# Altium project PI_Board.PrjPcb
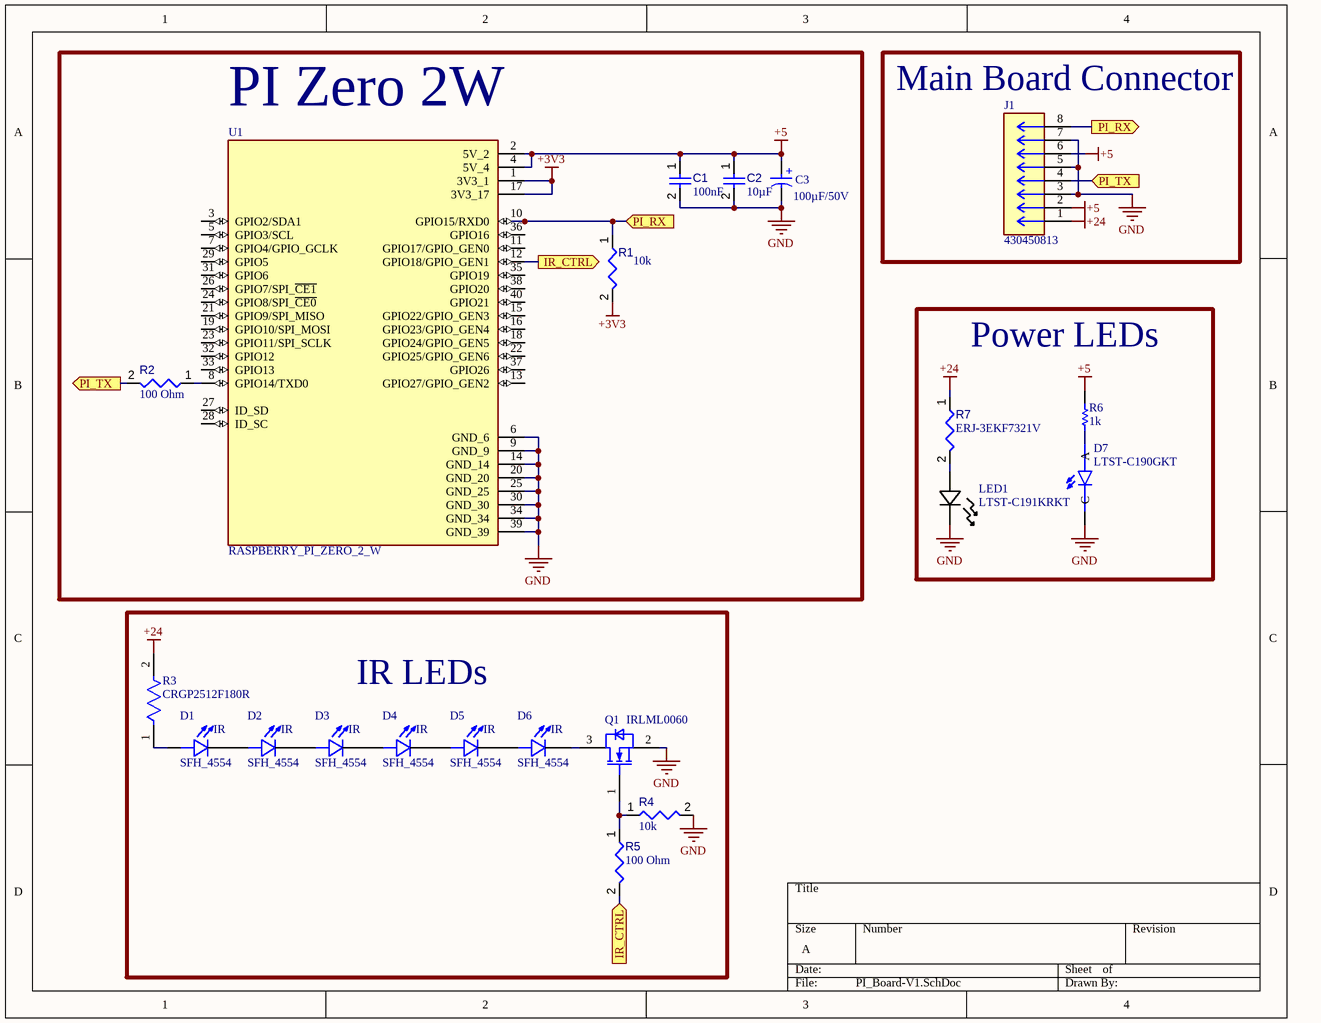
[diagram p0: PI_Board-V1.SchDoc]
CAGE_CODE: ?????; CONTRACT_NUMBER: <CONTRACT NO>; DOC_NO_ASSY_DWG: <ASSY DWG NO>; DOC_NO_BOM: <BOM DOC NO>; DOC_NO_FAB_DWG: <FAB DWG NO>; DOC_NO_SCH_DWG: <SCH DWG NO>; PCB_2_DEC_TOL: +/-.01; PCB_3_DEC_TOL: +/-.010; PCB_ANG_TOL: +/-1/2; PCB_ASSEMBLY_NO: <PCB ASSY NO>; PCB_CHECKER: - -----; PCB_CHECKER_APP_DATE: --/--/----; PCB_DESIGNER: - -----; PCB_DESIGNER_APP_DATE: --/--/----; PCB_DWG_NO: <PCB DWG NO>; PCB_ENGINEER: - -----; PCB_ENGINEER_APP_DATE: --/--/----; PCB_PART_NUMBER: <PCB PN>; PCB_REV: A; SCH_REV: A
1 sheet, 21 parts. Net scope: flat (ports and power ports of the same name join across sheets).
Board file: PI_V1.PcbDoc

## Sheet PI_Board-V1.SchDoc
size A

### Parts
C1  value 100nF  [CAPC1608X90X40NL10T20]  (hidden comment: Capacitor 100 nF +/-10% 50 V 0603)
C2  value 10µF  [CAPC2013X135X45NL10T25]  (hidden comment: Capacitor 10 uF +/- 10% 16 V 0805)
C3  100µF/50V  [WCAP-ASLI_D6.3H7.7]
D1  SFH_4554  [DIO_SFH_4554]
D2  SFH_4554  [DIO_SFH_4554]
D3  SFH_4554  [DIO_SFH_4554]
D4  SFH_4554  [DIO_SFH_4554]
D5  SFH_4554  [DIO_SFH_4554]
D6  SFH_4554  [DIO_SFH_4554]
D7  LTST-C190GKT  [LEDM1608X80]
J1  430450813  [CONN_SD-43045-005_08_MOL]
LED1  LTST-C191KRKT  [LED_LTST-C191KRKT_LTO]
Q1  IRLML0060  [SOT95P237X112-3N-2-V]
R1  value 10k  [RESC0402(1005)_L]  (hidden comment: 10KR2F)
R2  value 100 Ohm  [RESC0402(1005)_L]  (hidden comment: 100R2F)
R3  CRGP2512F180R  [FP-CRGP2512-IPC_C]
R4  value 10k  [RESC0402(1005)_L]  (hidden comment: 10KR2F)
R5  value 100 Ohm  [RESC0402(1005)_L]  (hidden comment: 100R2F)
R6  value 1k  [RESC1005X40X25ML05T05]  (hidden comment: Resistor 1k +/-1% 0402 100 mW)
R7  value ERJ-3EKF7321V  [RESC0603(1608)_L]  (hidden comment: 120R3J)
U1  RASPBERRY_PI_ZERO_2_W  [MODULE_RASPBERRY_PI_ZERO_2_W]

### Blocks framed on the sheet
PI Zero 2W: C1-C3 R1 R2 U1
Main Board Connector: J1
Power LEDs: D7 LED1 R6 R7
IR LEDs: D1-D6 Q1 R3-R5

### Ports
IR_CTRL (in), IR_CTRL (out), PI_RX (in), PI_RX (out), PI_TX (in), PI_TX (out)

### Nets
+3V3: R1.2 U1.1(3V3_1) U1.17(3V3_17)
+5: C1.1 C2.1 C3.1(P) J1.2 J1.6 R6.1 U1.2(5V_2) U1.4(5V_4)
+24: J1.1 R3.2 R7.1
GND: C1.2 C2.2 C3.2(N) D7.C J1.3 J1.5 J1.7 LED1.1 Q1.2(SOURCE) R4.2 U1.6(GND_6) U1.9(GND_9) U1.14(GND_14) U1.20(GND_20) U1.25(GND_25) U1.30(GND_30) U1.34(GND_34) U1.39(GND_39)
NetD1_A: D1.A R3.1
NetD1_C: D1.C D2.A
NetD2_C: D2.C D3.A
NetD3_C: D3.C D4.A
NetD4_C: D4.C D5.A
NetD5_C: D5.C D6.A
NetD6_C: D6.C Q1.3(DRAIN)
NetD7_A: D7.A R6.2
NetJ1_4: J1.4 R2.2 ; port PI_TX
NetJ1_8: J1.8 R1.1 U1.10(GPIO15/RXD0) ; port PI_RX
NetLED1_2: LED1.2 R7.2
NetQ1_1: Q1.1(GATE) R4.1 R5.1
NetR2_1: R2.1 U1.8(GPIO14/TXD0)
NetR5_2: R5.2 U1.12(GPIO18/GPIO_GEN1) ; port IR_CTRL

Not connected (* = marked no-connect by the designer): U1 3(GPIO2/SDA1) 5(GPIO3/SCL) 7(GPIO4/GPIO_GCLK) 11(GPIO17/GPIO_GEN0) 13(GPIO27/GPIO_GEN2) 15(GPIO22/GPIO_GEN3) 16(GPIO23/GPIO_GEN4) 18(GPIO24/GPIO_GEN5) 19(GPIO10/SPI_MOSI) 21(GPIO9/SPI_MISO) 22(GPIO25/GPIO_GEN6) 23(GPIO11/SPI_SCLK) 24(GPIO8/SPI_~{CE0}) 26(GPIO7/SPI_~{CE1}) 27(ID_SD) 28(ID_SC) 29(GPIO5) 31(GPIO6) 32(GPIO12) 33(GPIO13) 35(GPIO19) 36(GPIO16) 37(GPIO26) 38(GPIO20) 40(GPIO21)

### Notes on the sheet
- (in symbol CMP-03913-54202496-2) +
- (in symbol SFH_4554) IR

### Library data of the parts
C1 = CMP-001-00017-6: Chip Capacitor, 100 nF, +/- 10%, 50 V, 0603 (1608 Metric); Voltage Rating: 50V; Capacitor Type: Ceramic; Tolerance: 10%; Mounting Technology: SM; Max Operating Temperature: 125°C; RoHS Compliant: True; Pins: 2; Case/Package: 0603; Min Operating Temperature: -55°C
C2 = CMP-001-00015-6: Chip Capacitor, 10 uF, +/- 10%, 16 V, 0805 (2012 Metric); Voltage Rating: 16V; Capacitor Type: Ceramic; RoHS Compliant: True; Max Operating Temperature: 85°C; Min Operating Temperature: -55°C; Mounting Technology: SM; Tolerance: 10%; Case/Package: 0805; Pins: 2
C3 = CMP-03913-54202496-2: Cap Aluminum Lytic 100uF 35V 20% (6.3 X 7.7mm) SMD 300mA 2000h 105C T/R; Capacitance: 100µF; Impedance: 380mΩ; Insulation Resistance: 1MΩ; ESR (Equivalent Series Resistance): 321.392mΩ; Dissipation Factor: 14%; Leakage Current: 35µA; Life (Hours): 2000hours; Min Operating Temperature: -55°C; Height: 7.7mm; Tolerance: 20%; Ripple Current (AC): 300mA; Length: 7.7mm; Width: 6.6mm; Voltage Rating: 35V; REACH SVHC: Unknown; Ripple Current: 300mA; Diameter: 6.3mm; Max Operating Temperature: 105°C; RoHS: Compliant; Voltage Rating (DC): 35V; Packaging: Cut Tape; Case/Package: Radial
D1-D6 = SFH_4554: Infrared (IR) Emitter 850nm 1.7V 100mA 550mW/sr @ 100mA 20Â° Radial; MF: OSRAM Opto; SnapEDA_Link: https://www.snapeda.com/parts/SFH%204554/OSRAM/view-part/?ref=snap; Package: Radial OSRAM Opto; Value: *; MP: SFH 4554; Check_prices: https://www.snapeda.com/parts/SFH%204554/OSRAM/view-part/?ref=eda
D7 = LTST-C190GKT: MF: {'manufacturer': u'Lite-On Inc.'}; Package: None; Price: None; Value: *; MP: LTST-C190GKT; Availability: Unavailable
LED1 = LTST-C191KRKT: Description; Manufacturer_Name: LITE-ON; Copyright: Copyright (C) 2025 Ultra Librarian. All rights reserved.; Manufacturer_Part_Number: LTST-C191KRKT
Q1 = IRLML0060: Insulated-Gate Field-Effect Transistor (IGFET), N-Channel, Enhancement, Body Diode, Pin 1 Gate, 2 Source, 3 Drain, 3 Pins; Manufacturer: Infineon Technologies; Manufacturer Order Number: IRLML0060; PackageReference: PG-SOT23-3-901
R1 R4 = CMP-009-00066-2: 10K 0.063W 1% 0402 (1005 Metric)  SMD; Power: 63mW; Case/Package: 0402; Mounting Technology: SMT; Pins: 2; Tolerance: 1%
R2 R5 = CMP-009-00065-2: 100R 0.063W 1% 0402 (1005 Metric)  SMD; Power: 63mW; Tolerance: 1%; Case/Package: 0402; Pins: 2; Mounting Technology: SMT
R3 = CMP-03211-003209-1: Res, 180R, 1%, 2W, 2512, Thick Film; Manufacturer: TE; Voltage Rating: 500V; Resistance: 180Ω; Tolerance: 0.01; Value: 180Ω; Temperature Coefficient: ±100ppm/°C; Device Class L1: Passive Components; Digikey Description: Res, 180R, 1%, 2W, 2512, Thick Film; Device Class L3: Chip SMD Resistors; RoHS: TRUE; Height: 0.65mm; Automotive: No; Ambient Temperature Range High: +70°C; Manufacturer Part Number: CRGP2512F180R; ComponentLink2Description: Datasheet; ComponentLink2URL: https://www.mouser.ca/datasheet/2/418/NG_DS_9-1773463-9_A-1358566.pdf; Temperature Range Low: -55°C; Series: CRGP; Package: CRGP2512; Category: Res; Lead Free: Yes; Device Class L2: Resistors; Ipc Land Pattern Name: RESC635320X55; Composition: Thick Film; Mouser Description: Res, 180R, 1%, 2W, 2512, Thick Film; Power Rating: 2W; Temperature Range High: +155°C; Temperature: -55°C to +155°C; Octopart: https://octopart.com/crgp2512f180r-te+connectivity-91019037
R6 = CMP-009-00009-5: Chip Resistor, 1 KOhm, +/- 1%, 0.1 W, -55 to 155 degC, 0402 (1005 Metric); Power: 100mW; Voltage Rating: 50V; Min Operating Temperature: -55°C; Max Operating Temperature: 155°C; RoHS Compliant: True; Mounting Technology: SM; Pins: 2; Tolerance: 1%; Case/Package: 0402
R7 = CMP-009-00069-2: 120R 0.1W 5% 0603 (1608 Metric)  SMD; Power: 100mW; Mounting Technology: SMT; Tolerance: 5%; Case/Package: 0603; Pins: 2
U1 = RASPBERRY_PI_ZERO_2_W: At the heart of Raspberry Pi Zero 2 W is RP3A0, a custom-built system-in-package designed by Raspberry Pi in the UK.; SnapEDA_Link: https://www.snapeda.com/parts/RASPBERRY%20PI%20ZERO%202%20W/Raspberry+Pi/view-part/?ref=snap; Package: None; Value: *; MF: Raspberry Pi; MP: RASPBERRY PI ZERO 2 W; Check_prices: https://www.snapeda.com/parts/RASPBERRY%20PI%20ZERO%202%20W/Raspberry+Pi/view-part/?ref=eda
J1 = 430450813: Package: None; Price: None; Value: *; MP: 430450813; Availability: Unavailable